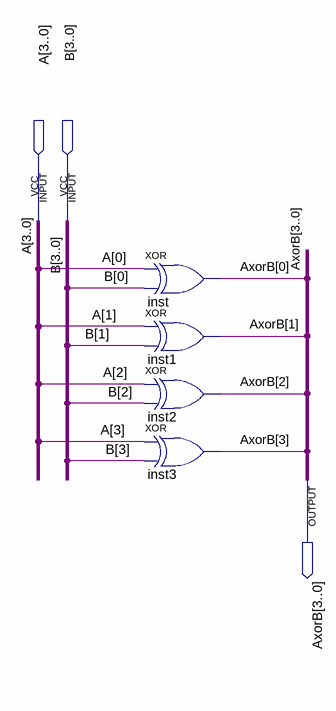
[diagram p0: schematic sheet]
// Quartus schematic AxorB.bdf as structural Verilog: 4 symbols, 3 pins
module AxorB (
  input  [3:0] A,
  input  [3:0] B,
  output [3:0] AxorB
);

  xor inst (AxorB[0], A[0], B[0]);
  xor inst1 (AxorB[1], A[1], B[1]);
  xor inst2 (AxorB[2], A[2], B[2]);
  xor inst3 (AxorB[3], A[3], B[3]);
endmodule
